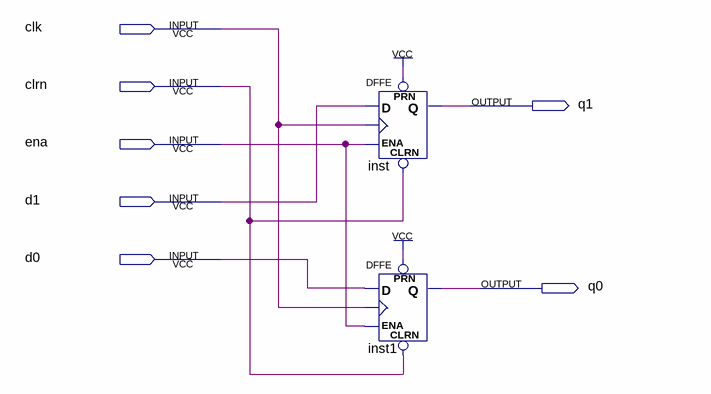
[diagram p0: schematic sheet]
// Quartus schematic casa.bdf as structural Verilog: 2 symbols, 7 pins
module casa (
  input  clk,
  input  clrn,
  input  ena,
  input  d1,
  input  d0,
  output q1,
  output q0
);

  DFFE inst (.PRN(1'b1), .CLRN(clrn), .D(d1), .CLK(clk), .ENA(ena), .Q(q1));
  DFFE inst1 (.PRN(1'b1), .CLRN(clrn), .D(d0), .CLK(clk), .ENA(ena), .Q(q0));
endmodule
